# EAGLE board 1700-0002_InterfaceBoard_RevA (EAGLE 7.7.0), part 1 of 2
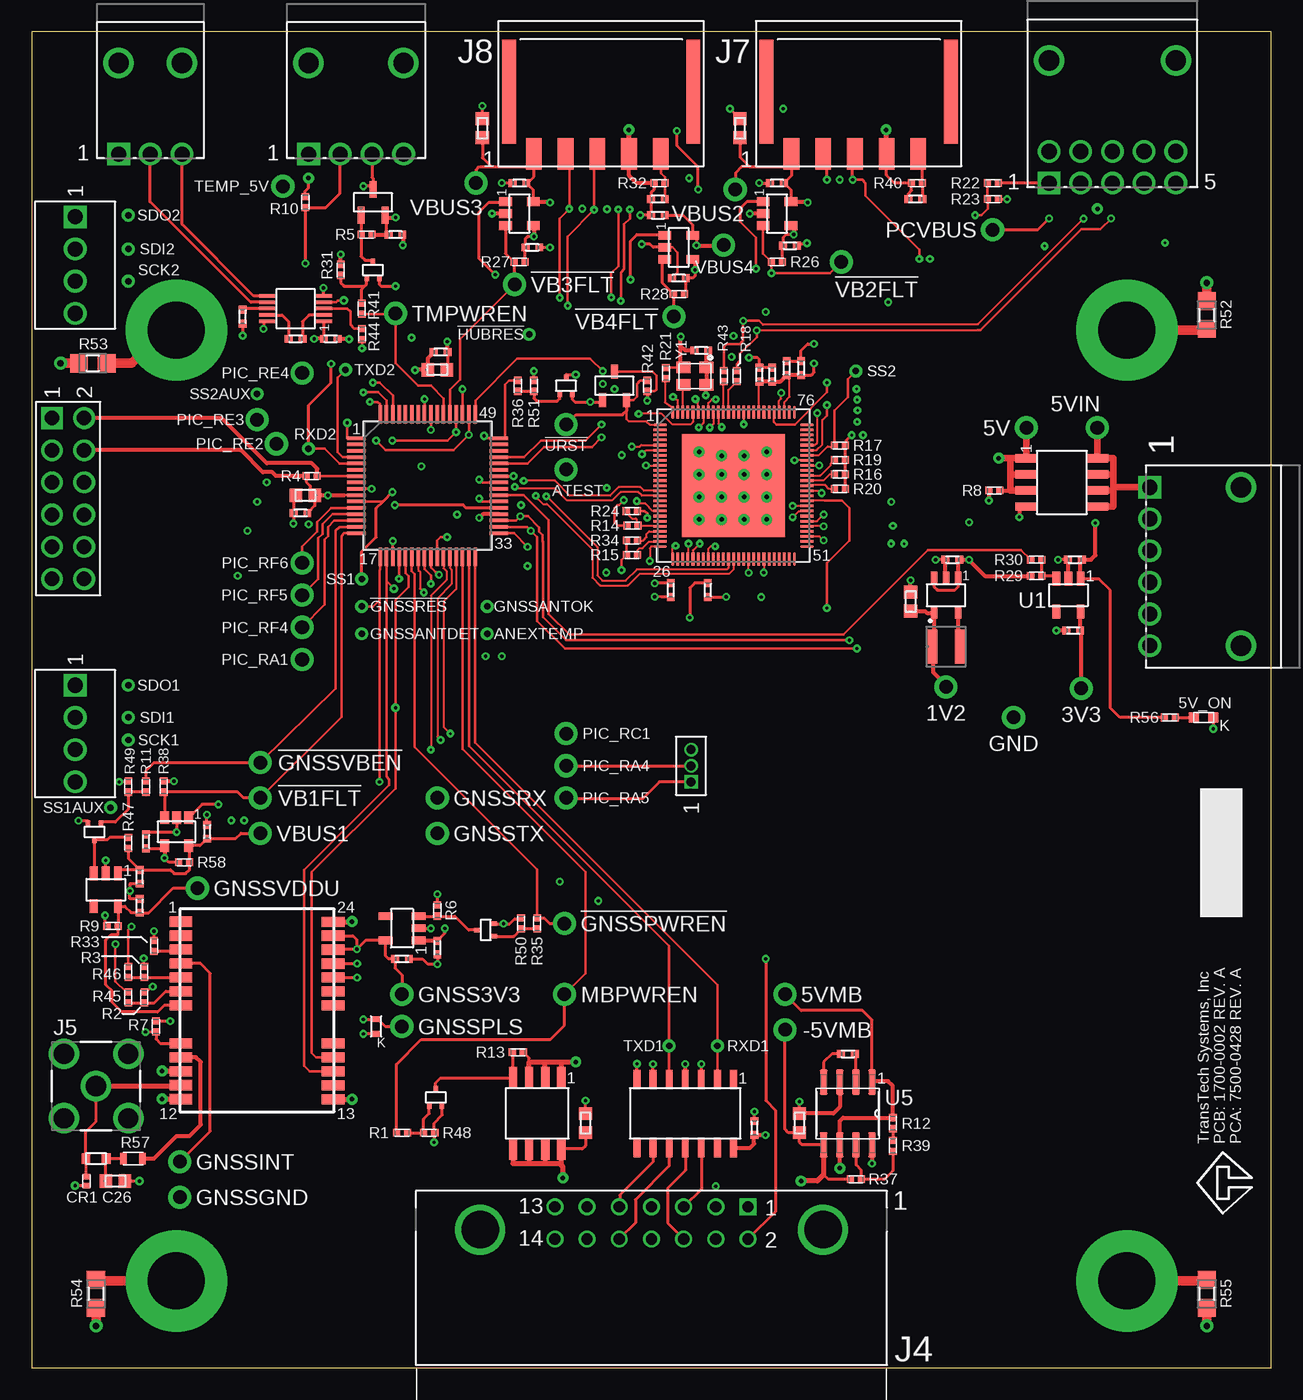
[diagram p8: board, top side]
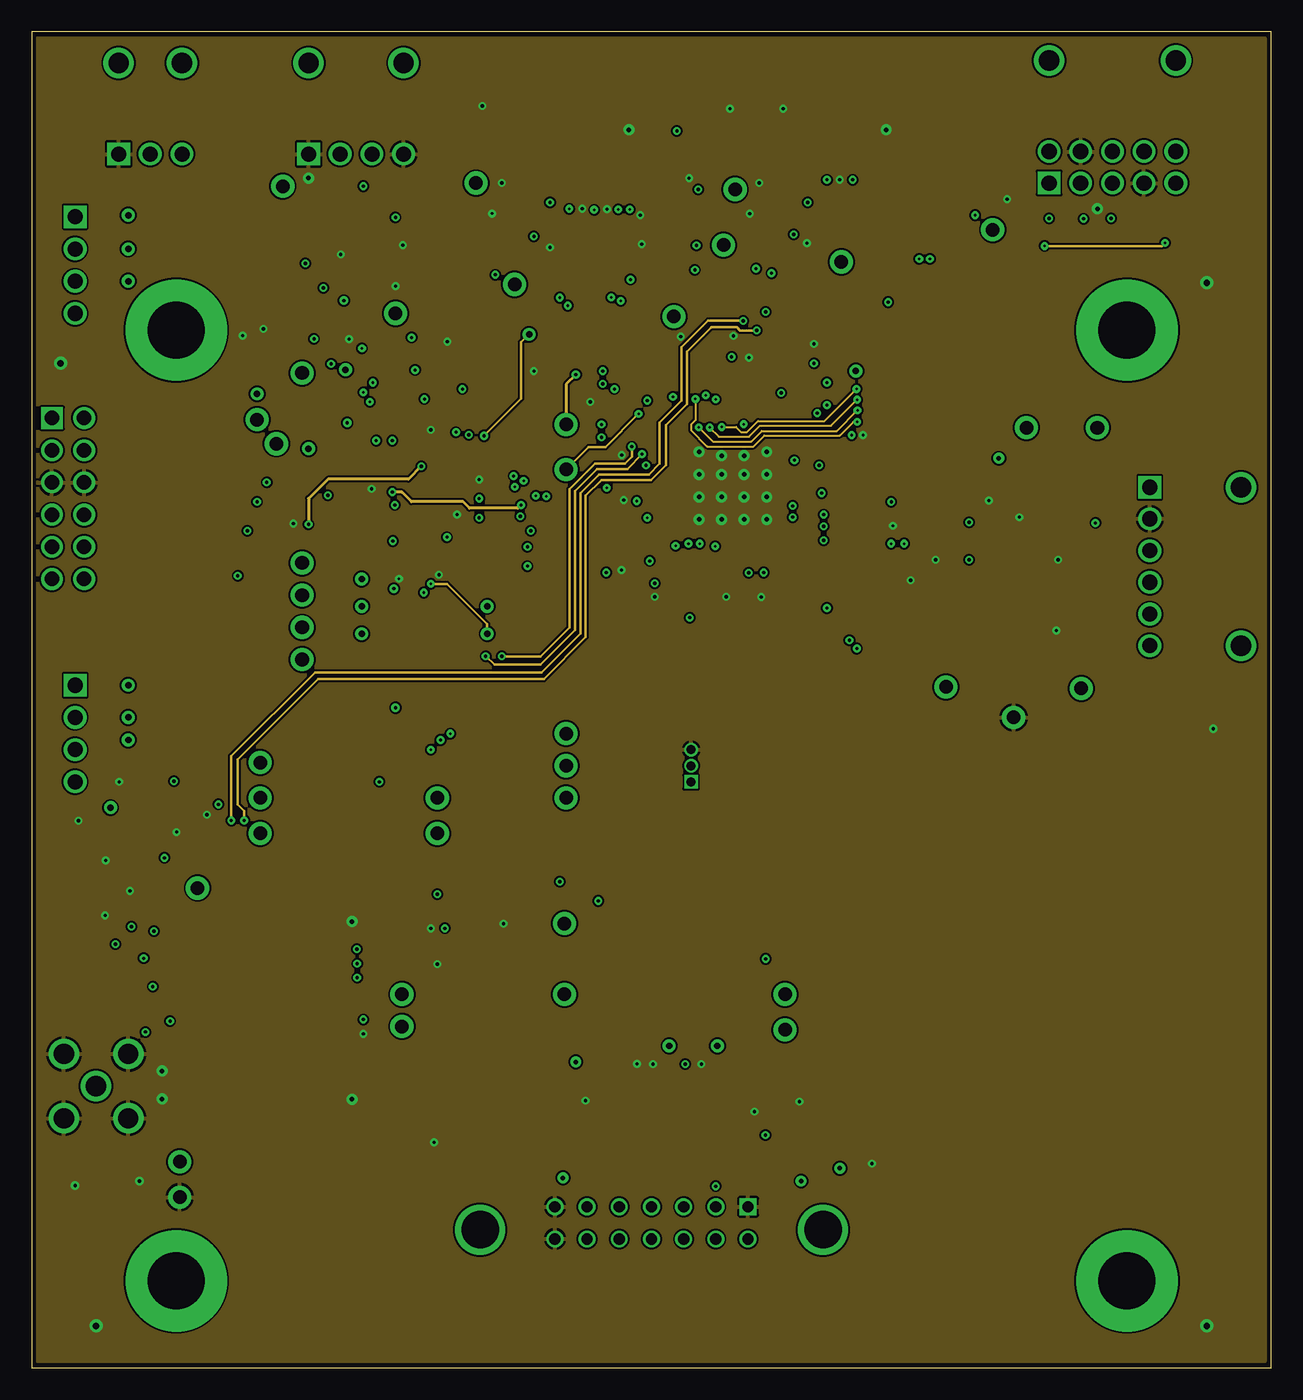
[diagram p9: board, inner layer GND+Signal]
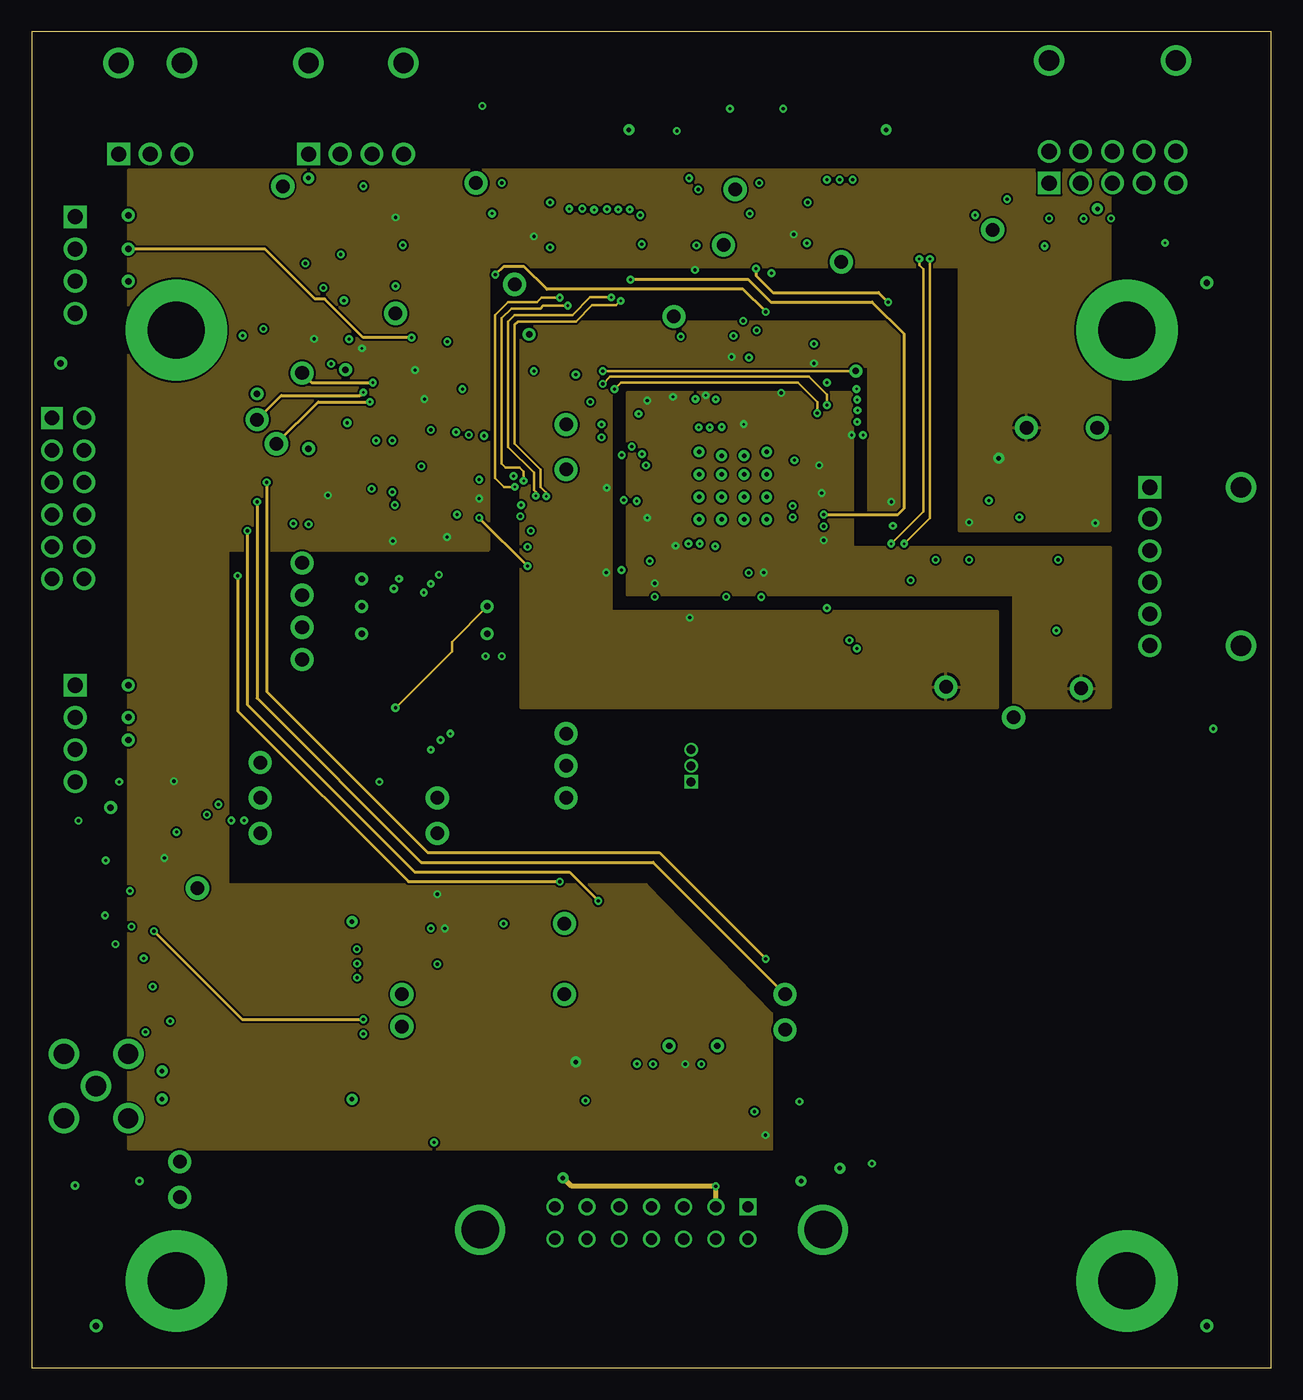
[diagram p10: board, inner layer PWR+Signal]
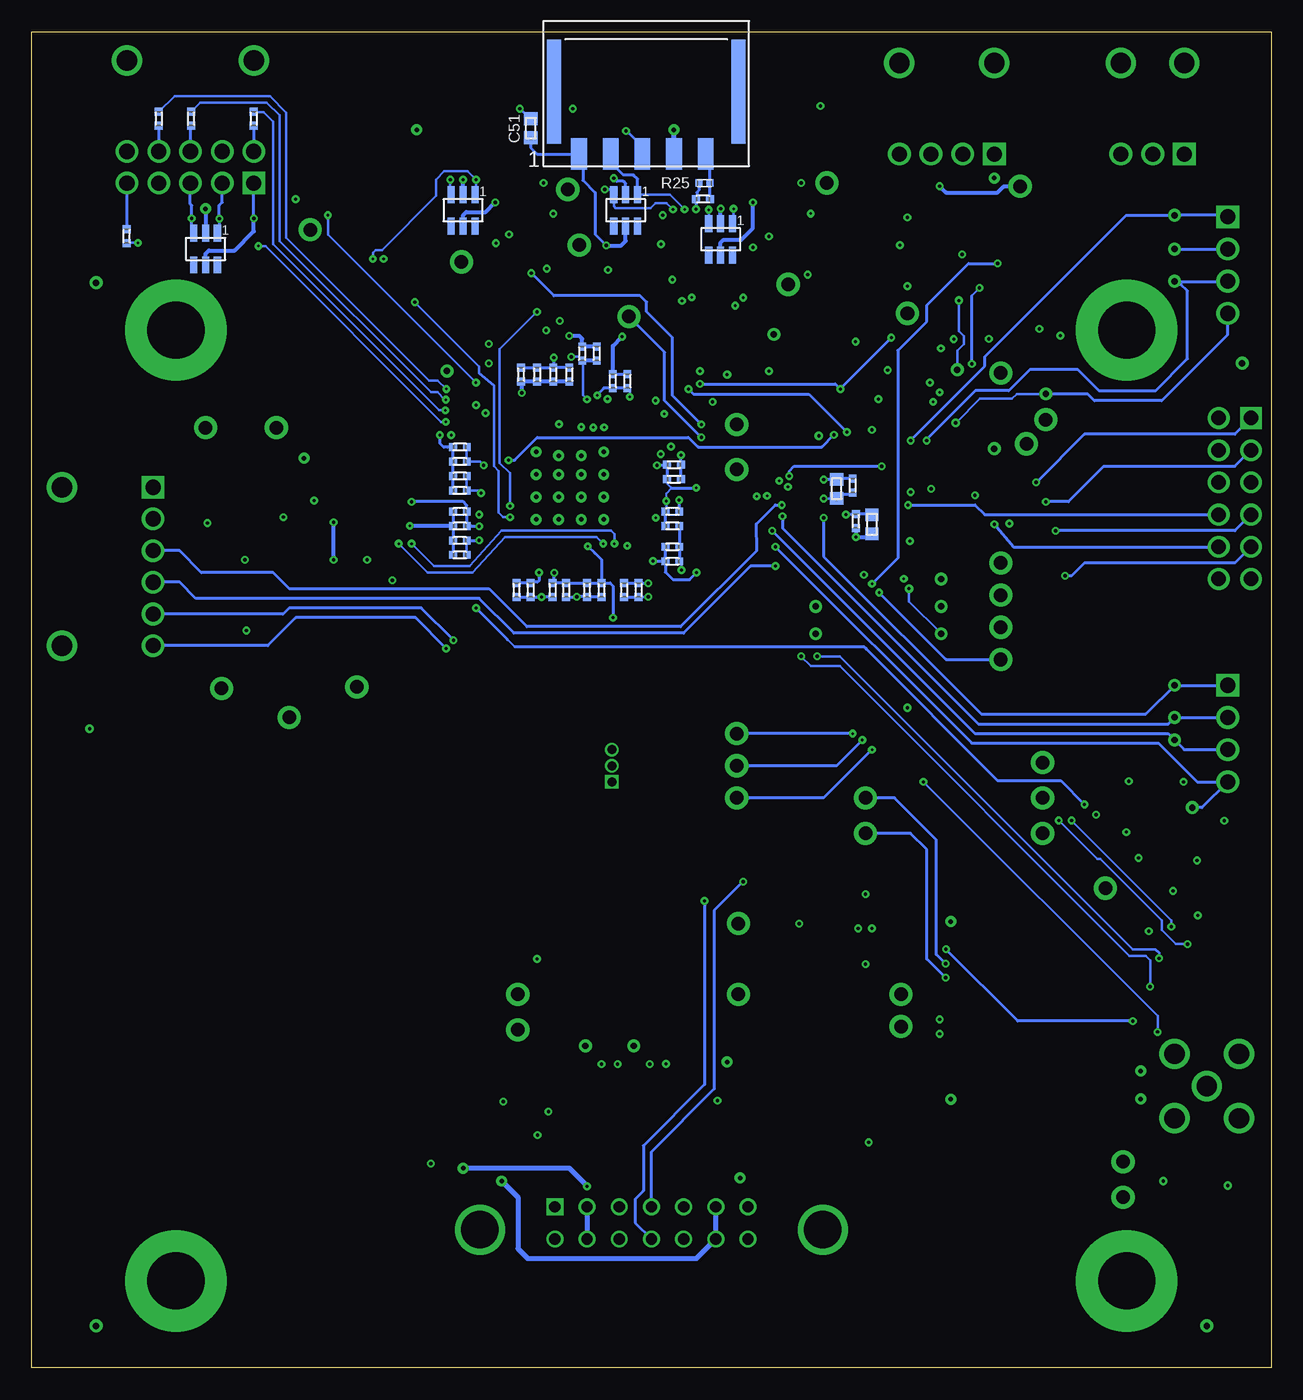
[diagram p11: board, bottom side, seen from below]

Size 97.79 x 105.41 mm. Coordinates in mm from the lower left corner, seen from the top.
Outline: 0,0 97.79,0 97.79,105.41 0,105.41 0,0
Copper layers (1+2*15+16): Top 0.035mm / dielectric 0.11mm / GND+Signal 0.035mm / dielectric 1.2mm / PWR+Signal 0.035mm / dielectric 0.11mm / Bottom 0.035mm
Design rules "PCBWay_4L_100um-Track": minimum track width 0.1mm, minimum drill 0.3mm, track to track 0.1mm, track to pad 0.1mm, pad to pad 0.1mm, via to via 0.1mm, smd to smd 0mil, copper to edge 0.3mm, drill to drill 10mil, minimum pad ring 6mil, minimum via ring 0.1mm, stop-mask expansion 2mil, vias tented up to drill 0.45mm, thermal gap 0.2mm
Net classes: 0 default: width 0.152 mm, drill 0.203 mm, clearance 0.152 mm

## Footprints (pad centres in the part's own frame; a part is rotated, then mirrored left to right if it is on the bottom)
TST_POINT_PTH_042-OCT = drill 1.067 pad 1.829: P$1 0,0
LED_0603_LITE-ON = smd 0.787 x 0.787: 1 -0.762,0; 2 0.762,0
TST_POINT_PTH_20X40MIL_2PIN = drill 0.508 pad 1.016: P$1 0,0; P$2 0,0
G-155_MUR = smd 0.62 x 0.62: 1 -0.546,0; 2 0.546,0
CAP_C1608_TDK = smd 1 x 1.05: 1 -0.75,0; 2 0.75,0
SOD-923F_COMCHIP = smd 0.406 x 0.61: 1 -0.356,0; 2 0.356,0
LED_DIALIGHT_598_DIA = smd 0.445 x 0.711: 1 -0.578,0; 2 0.578,0
CON_1053131306 = drill 1.194 pad 1.702 square: 1 0,0 | drill 1.194 pad 1.702: 2 -2.489,0; 3 -5.004,0; 4 -7.493,0; 5 -10.008,0; 6 -12.497,0 | drill 1.6 pad 1.6: 7 0,-7.188; 8 -12.497,-7.188
CON_1053141310 = drill 1.194 pad 1.702 square: 1 0,0 | drill 1.194 pad 1.702: 2 -2.489,0; 3 -5.004,0; 4 -7.493,0; 5 -10.008,0; 6 0,-2.489; 7 -2.489,-2.489; 8 -5.004,-2.489; 9 -7.493,-2.489; 10 -10.008,-2.489 | drill 1.6 pad 1.6: 11 0,-9.677; 12 -10.008,-9.677
CON_1053131303 = drill 1.194 pad 1.702 square: 1 0,0 | drill 1.194 pad 1.702: 2 -2.489,0; 3 -5.004,0 | drill 1.6 pad 1.6: 4 0,-7.188; 5 -5.004,-7.188
3M_N3314-5302RB_RA = drill 0.889 square: 1 -7.62,-1.27 | drill 0.889: 2 -7.62,1.27; 3 -5.08,-1.27; 4 -5.08,1.27; 5 -2.54,-1.27; 6 -2.54,1.27; 7 0,-1.27; 8 0,1.27; 9 2.54,-1.27; 10 2.54,1.27; 11 5.08,-1.27; 12 5.08,1.27; 13 7.62,-1.27; 14 7.62,1.27 | drill 2.946: 15 -13.538,0.533; 16 13.513,0.533
SAMTEC_SMA-J-P-X-ST-TH1 = drill 1.6: 1 0,0; 2 2.54,-2.54; 3 2.54,2.54; 4 -2.54,2.54; 5 -2.54,-2.54
CON_1053131304 = drill 1.194 pad 1.702 square: 1 0,0 | drill 1.194 pad 1.702: 2 -2.489,0; 3 -5.004,0; 4 -7.493,0 | drill 1.6 pad 1.6: 5 0,-7.188; 6 -7.493,-7.188
CON_1054301305_MOL = smd 1.24 x 2.5: 1 0,0; 2 -2.5,0; 3 -5,0; 4 -7.5,0; 5 -10,0 | smd 1.1 x 8.2: 6 1.97,-4.93; 7 -12.57,-4.93
MOLEX_VERT-HDR_171861004 = drill 1.194 pad 1.702 square: 1 -3.81,0 | drill 1.194 pad 1.702: 2 -1.27,0; 3 1.27,0; 4 3.81,0
CONN_GRPB031VWVN-RC_SUL = drill 0.711 pad 0.965 square: 1 0,0 | drill 0.711 pad 0.965: 2 1.27,0; 3 2.54,0
IND_TAIYO_NR3012_TAY = smd 0.8 x 2.692: 1 -1.099,0; 2 1.099,0
INDUCTOR_0603_TDK = smd 0.7 x 0.8: 1 -0.8,0; 2 0.8,0
CON_901311086_MOL = drill 1.143 pad 1.499 square: 1 0,0 | drill 1.143 pad 1.499: 2 0,2.54; 3 2.54,0; 4 2.54,2.54; 5 5.08,0; 6 5.08,2.54; 7 7.62,0; 8 7.62,2.54; 9 10.16,0; 10 10.16,2.54; 11 12.7,0; 12 12.7,2.54
PTH_M4_4.5MM-ID = drill 4.5 pad 8: P$1 0,0
SO-8L-NB_FAS = smd 1.753 x 0.66: 1 -2.8,1.905; 2 -2.8,0.635; 3 -2.8,-0.635; 4 -2.8,-1.905; 5 2.8,-1.905; 6 2.8,-0.635; 7 2.8,0.635; 8 2.8,1.905
SC-75(SOT-416)_ONSEMI = smd 0.356 x 0.508: 1 -0.495,-0.648; 2 0.495,-0.648; 3 0,0.648
SOT_1CDS-T1-BE3_VIS = smd 0.559 x 1.321: 1 -0.95,-1.016; 2 0.95,-1.016; 3 0,1.016
RESC1005X35N = smd 0.56 x 0.6: 1 -0.435,0; 2 0.435,0
STA_HCJ0805_STP = smd 1.4 x 1.44: 1 -1.1,0; 2 1.1,0
STA_RMCF0603_STP = smd 0.5 x 0.9: 1 -0.75,0; 2 0.75,0
DBV0005A_L = smd 1.1 x 0.6: 1 -1.3,0.95; 2 -1.3,0; 3 -1.3,-0.95; 4 1.3,-0.95; 5 1.3,0.95
DBV5_TEX = smd 0.978 x 0.508: 1 -1.365,0.95; 2 -1.365,0; 3 -1.365,-0.95; 4 1.365,-0.95; 5 1.365,0.95
SOT-23-6_AOS = smd 1.321 x 0.559: 1 -1.245,0.94; 2 -1.245,0; 3 -1.245,-0.94; 4 1.245,-0.94; 5 1.245,0; 6 1.245,0.94
21-0061L_MXM = smd 1.359 x 0.279: 1 -2.203,1; 2 -2.203,0.5; 3 -2.203,0; 4 -2.203,-0.5; 5 -2.203,-1; 6 2.203,-1; 7 2.203,-0.5; 8 2.203,0; 9 2.203,0.5; 10 2.203,1
SOIC127P600X175-8N = smd 1.97 x 0.59: 1 -2.475,1.905; 2 -2.475,0.635; 3 -2.475,-0.635; 4 -2.475,-1.905; 5 2.475,-1.905; 6 2.475,-0.635; 7 2.475,0.635; 8 2.475,1.905
21-0041B_14_MXM = smd 1.46 x 0.533: 1 -2.724,3.81; 2 -2.724,2.54; 3 -2.724,1.27; 4 -2.724,0; 5 -2.724,-1.27; 6 -2.724,-2.54; 7 -2.724,-3.81; 8 2.724,-3.81; 9 2.724,-2.54; 10 2.724,-1.27; 11 2.724,0; 12 2.724,1.27; 13 2.724,2.54; 14 2.724,3.81
TSOT-25_DIODES-INC = smd 1 x 0.7: 1 -1.1,0.95; 2 -1.1,0; 3 -1.1,-0.95; 4 1.1,-0.95; 5 1.1,0.95
UBLOX_24LCC = smd 1.8 x 0.8: 1 6.001,-7.004; 2 6.001,-5.904; 3 6.001,-4.804; 4 6.001,-3.704; 5 6.001,-2.604; 6 6.001,-1.504; 7 6.001,-0.404; 8 6.001,2.596; 9 6.001,3.696; 10 6.001,4.796; 11 6.001,5.896; 12 6.001,6.996; 13 -6.001,7.004; 14 -6.001,5.904; 15 -6.001,4.804; 16 -6.001,3.704; 17 -6.001,2.604; 18 -6.001,-0.396; 19 -6.001,-1.496; 20 -6.001,-2.596; 21 -6.001,-3.696; 22 -6.001,-4.796; 23 -6.001,-5.896; 24 -6.001,-6.996
TQFP64_10X10MC_MCH = smd 1.462 x 0.279: 1 -5.613,3.75; 2 -5.613,3.25; 3 -5.613,2.75; 4 -5.613,2.25; 5 -5.613,1.75; 6 -5.613,1.25; 7 -5.613,0.75; 8 -5.613,0.25; 9 -5.613,-0.25; 10 -5.613,-0.75; 11 -5.613,-1.25; 12 -5.613,-1.75; 13 -5.613,-2.25; 14 -5.613,-2.75; 15 -5.613,-3.25; 16 -5.613,-3.75; 33 5.613,-3.75; 34 5.613,-3.25; 35 5.613,-2.75; 36 5.613,-2.25; 37 5.613,-1.75; 38 5.613,-1.25; 39 5.613,-0.75; 40 5.613,-0.25; 41 5.613,0.25; 42 5.613,0.75; 43 5.613,1.25; 44 5.613,1.75; 45 5.613,2.25; 46 5.613,2.75; 47 5.613,3.25; 48 5.613,3.75 | smd 0.279 x 1.462: 17 -3.75,-5.613; 18 -3.25,-5.613; 19 -2.75,-5.613; 20 -2.25,-5.613; 21 -1.75,-5.613; 22 -1.25,-5.613; 23 -0.75,-5.613; 24 -0.25,-5.613; 25 0.25,-5.613; 26 0.75,-5.613; 27 1.25,-5.613; 28 1.75,-5.613; 29 2.25,-5.613; 30 2.75,-5.613; 31 3.25,-5.613; 32 3.75,-5.613; 49 3.75,5.613; 50 3.25,5.613; 51 2.75,5.613; 52 2.25,5.613; 53 1.75,5.613; 54 1.25,5.613; 55 0.75,5.613; 56 0.25,5.613; 57 -0.25,5.613; 58 -0.75,5.613; 59 -1.25,5.613; 60 -1.75,5.613; 61 -2.25,5.613; 62 -2.75,5.613; 63 -3.25,5.613; 64 -3.75,5.613
SOT-23_M3_MCH = smd 0.559 x 1.118: 1 -0.95,-1.118; 2 0.95,-1.118; 3 0,1.118
VQFN100_KDX_MCH = smd 1.016 x 0.203: 1 -5.791,4.8; 2 -5.791,4.4; 3 -5.791,4; 4 -5.791,3.6; 5 -5.791,3.2; 6 -5.791,2.8; 7 -5.791,2.4; 8 -5.791,2; 9 -5.791,1.6; 10 -5.791,1.2; 11 -5.791,0.8; 12 -5.791,0.4; 13 -5.791,0; 14 -5.791,-0.4; 15 -5.791,-0.8; 16 -5.791,-1.2; 17 -5.791,-1.6; 18 -5.791,-2; 19 -5.791,-2.4; 20 -5.791,-2.8; 21 -5.791,-3.2; 22 -5.791,-3.6; 23 -5.791,-4; 24 -5.791,-4.4; 25 -5.791,-4.8; 51 5.791,-4.8; 52 5.791,-4.4; 53 5.791,-4; 54 5.791,-3.6; 55 5.791,-3.2; 56 5.791,-2.8; 57 5.791,-2.4; 58 5.791,-2; 59 5.791,-1.6; 60 5.791,-1.2; 61 5.791,-0.8; 62 5.791,-0.4; 63 5.791,0; 64 5.791,0.4; 65 5.791,0.8; 66 5.791,1.2; 67 5.791,1.6; 68 5.791,2; 69 5.791,2.4; 70 5.791,2.8; 71 5.791,3.2; 72 5.791,3.6; 73 5.791,4; 74 5.791,4.4; 75 5.791,4.8 | smd 0.203 x 1.016: 26 -4.8,-5.791; 27 -4.4,-5.791; 28 -4,-5.791; 29 -3.6,-5.791; 30 -3.2,-5.791; 31 -2.8,-5.791; 32 -2.4,-5.791; 33 -2,-5.791; 34 -1.6,-5.791; 35 -1.2,-5.791; 36 -0.8,-5.791; 37 -0.4,-5.791; 38 0,-5.791; 39 0.4,-5.791; 40 0.8,-5.791; 41 1.2,-5.791; 42 1.6,-5.791; 43 2,-5.791; 44 2.4,-5.791; 45 2.8,-5.791; 46 3.2,-5.791; 47 3.6,-5.791; 48 4,-5.791; 49 4.4,-5.791; 50 4.8,-5.791; 76 4.8,5.791; 77 4.4,5.791; 78 4,5.791; 79 3.6,5.791; 80 3.2,5.791; 81 2.8,5.791; 82 2.4,5.791; 83 2,5.791; 84 1.6,5.791; 85 1.2,5.791; 86 0.8,5.791; 87 0.4,5.791; 88 0,5.791; 89 -0.4,5.791; 90 -0.8,5.791; 91 -1.2,5.791; 92 -1.6,5.791; 93 -2,5.791; 94 -2.4,5.791; 95 -2.8,5.791; 96 -3.2,5.791; 97 -3.6,5.791; 98 -4,5.791; 99 -4.4,5.791; 100 -4.8,5.791 | smd 8.103 x 8.103: 101 0,0
OSC_ECS-2033-250-BN = smd 1.1 x 0.9: 1 -0.9,-0.7; 2 0.9,-0.7; 3 0.9,0.7; 4 -0.9,0.7

## Placement (x,y rotation side)
1V2  TST_POINT_PTH_042-OCT  [TST_POINT_PTH_042-OCT]  72.14,53.72 0 top
3V3  TST_POINT_PTH_042-OCT  [TST_POINT_PTH_042-OCT]  82.8,53.59 0 top
5V  TST_POINT_PTH_042-OCT  [TST_POINT_PTH_042-OCT]  78.49,74.17 0 top
5V_ON  0603/RED/1.8V/2.5mA  [LED_0603_LITE-ON]  92.46,51.31 180 top
5VIN  TST_POINT_PTH_042-OCT  [TST_POINT_PTH_042-OCT]  84.07,74.17 0 top
5VMB  TST_POINT_PTH_042-OCT  [TST_POINT_PTH_042-OCT]  59.44,29.46 0 top
!GNSSPWREN  TST_POINT_PTH_042-OCT  [TST_POINT_PTH_042-OCT]  42.04,35.05 0 top
!GNSSRES  TST_POINT_PTH_20X40MIL_2PIN  [TST_POINT_PTH_20X40MIL_2PIN]  26.04,60.07 0 top
!GNSSVBEN  TST_POINT_PTH_042-OCT  [TST_POINT_PTH_042-OCT]  18.03,47.75 0 top
!HUBRES  TST_POINT_PTH_20X40MIL_2PIN  [TST_POINT_PTH_20X40MIL_2PIN]  39.24,81.53 0 top
!URST  TST_POINT_PTH_042-OCT  [TST_POINT_PTH_042-OCT]  42.16,74.42 0 top
!VB1FLT  TST_POINT_PTH_042-OCT  [TST_POINT_PTH_042-OCT]  18.03,44.96 0 top
!VB2FLT  TST_POINT_PTH_042-OCT  [TST_POINT_PTH_042-OCT]  63.88,87.25 0 top
!VB3FLT  TST_POINT_PTH_042-OCT  [TST_POINT_PTH_042-OCT]  38.1,85.47 0 top
!VB4FLT  TST_POINT_PTH_042-OCT  [TST_POINT_PTH_042-OCT]  50.67,82.93 0 top
-5VMB  TST_POINT_PTH_042-OCT  [TST_POINT_PTH_042-OCT]  59.44,26.67 0 top
ANEXTEMP  TST_POINT_PTH_20X40MIL_2PIN  [TST_POINT_PTH_20X40MIL_2PIN]  35.94,57.91 0 top
ATEST  TST_POINT_PTH_042-OCT  [TST_POINT_PTH_042-OCT]  42.16,70.87 0 top
C1  0.1/16V (0402)  [G-155_MUR]  33.02,69.6 90 bottom
C2  0.1/16V (0402)  [G-155_MUR]  21.21,67.44 180 top
C3  0.1/16V (0402)  [G-155_MUR]  20.83,81.18 0 top
C4  1nF (0402)  [G-155_MUR]  49.91,61.37 270 bottom
C5  1nF (0402)  [G-155_MUR]  50.8,77.85 90 bottom
C6  1nF (0402)  [G-155_MUR]  64.01,65.28 180 bottom
C7  0.1 (0402)  [G-155_MUR]  51.05,61.37 270 bottom
C8  0.1 (0402)  [G-155_MUR]  51.94,77.85 90 bottom
C9  0.1 (0402)  [G-155_MUR]  64.01,64.14 180 bottom
C10  10/10V (0603)  [CAP_C1608_TDK]  21.59,68.83 180 top
C11  0.1/16V (0402)  [G-155_MUR]  32.26,80.14 0 top
C12  0.1/16V (0402)  [G-155_MUR]  23.6,81.18 0 top
C13  0.1/16V (0402)  [G-155_MUR]  16.64,82.93 270 top
C14  1nF (0402)  [G-155_MUR]  64.01,69.22 180 bottom
C15  1nF (0402)  [G-155_MUR]  64.01,71.5 180 bottom
C16  1nF (0402)  [G-155_MUR]  59.18,78.36 90 bottom
C17  0.1 (0402)  [G-155_MUR]  64.01,70.36 180 bottom
C18  0.1 (0402)  [G-155_MUR]  64.01,72.64 180 bottom
C19  1/10V (0402)  [G-155_MUR]  8.51,38.73 270 top
C20  1/10V (0402)  [G-155_MUR]  8.51,36.45 90 top
C21  1nF (0402)  [G-155_MUR]  58.42,61.37 270 bottom
C22  1nF (0402)  [G-155_MUR]  56.64,78.36 90 bottom
C23  0.1 (0402)  [G-155_MUR]  57.91,78.36 90 bottom
C24  0.1 (0402)  [G-155_MUR]  55.37,78.36 90 bottom
C25  0.1 (0402)  [G-155_MUR]  58.42,78.36 90 top
C26  10nF/16V (0603)  [CAP_C1608_TDK]  6.6,14.73 0 top
C27  10/10V (0603)  [CAP_C1608_TDK]  32,78.74 0 top
C28  1nF (0402)  [G-155_MUR]  56.69,61.37 270 bottom
C29  0.1 (0402)  [G-155_MUR]  60.71,78.87 90 top
C30  1nF (0402)  [G-155_MUR]  47.12,71.25 0 bottom
C31  0.1 (0402)  [G-155_MUR]  64.01,67.56 180 bottom
C32  22/10V (0603)  [CAP_C1608_TDK]  60.58,19.3 90 top
C33  1/10V (0402)  [G-155_MUR]  59.82,88.52 0 top
C34  0.1/16V (0402)  [G-155_MUR]  57.02,18.92 90 top
C35  1nF (0402)  [G-155_MUR]  47.24,67.56 0 bottom
C36  1nF (0402)  [G-155_MUR]  47.24,64.77 0 bottom
C37  0.1 (0402)  [G-155_MUR]  54.36,80.01 90 bottom
C38  0.1 (0402)  [G-155_MUR]  53.98,61.37 270 bottom
C39  1nF (0402)  [G-155_MUR]  52.83,61.37 270 bottom
C40  1nF (0402)  [G-155_MUR]  53.21,80.01 90 bottom
C41  0.1 (0402)  [G-155_MUR]  47.24,63.63 0 bottom
C42  0.1 (0402)  [G-155_MUR]  47.24,66.42 0 bottom
C43  0.1/16V (0402)  [G-155_MUR]  13.84,42.29 90 top
C44  4.7/10V (0402)  [G-155_MUR]  50.42,61.37 270 top
C45  1nF (0402)  [G-155_MUR]  64.01,66.42 180 bottom
C46  0.1 (0402)  [G-155_MUR]  47.12,70.1 0 bottom
C47  1nF (0402)  [G-155_MUR]  59.56,78.87 90 top
C48  0.1 (0402)  [G-155_MUR]  55.63,61.37 270 bottom
C49  0.1/16V (0402)  [G-155_MUR]  52.83,80.26 180 top
C50  1/10V (0402)  [G-155_MUR]  32,33.15 270 top
C51  47/6.3V (0603)  [CAP_C1608_TDK]  58.42,97.79 90 bottom
C52  47/6.3V (0603)  [CAP_C1608_TDK]  35.56,97.79 90 top
C53  4.7/10V (0402)  [G-155_MUR]  53.34,61.37 270 top
C54  0.1/16V (0402)  [G-155_MUR]  58.8,93.47 180 top
C55  1nF (0402)  [G-155_MUR]  57.4,78.36 90 top
C56  22/10V (0603)  [CAP_C1608_TDK]  43.69,19.3 90 top
C58  1/10V (0402)  [G-155_MUR]  39.5,88.39 0 top
C59  1/10V (0402)  [G-155_MUR]  29.21,32.26 0 top
C60  0.1 (0402)  [G-155_MUR]  44.83,92.2 0 bottom
C61  0.1/16V (0402)  [G-155_MUR]  38.48,93.47 180 top
C62  1/10V (0402)  [G-155_MUR]  51.05,85.98 180 top
C63  0.1 (0402)  [G-155_MUR]  90.3,89.28 270 bottom
C64  0.1 (0402)  [G-155_MUR]  80.26,98.55 90 bottom
C65  0.1 (0402)  [G-155_MUR]  49.4,92.2 0 top
C66  0.1/16V (0402)  [G-155_MUR]  49.4,90.93 180 top
C67  0.1 (0402)  [G-155_MUR]  69.72,92.2 0 top
C68  0.1 (0402)  [G-155_MUR]  85.22,98.55 90 bottom
C69  0.1 (0402)  [G-155_MUR]  87.76,98.55 90 bottom
C70  47/6.3V (0603)  [CAP_C1608_TDK]  55.88,97.79 90 top
C71  1/10V (0402)  [G-155_MUR]  9.02,41.53 90 top
C72  1/10V (0402)  [G-155_MUR]  82.3,63.75 180 top
C73  1/10V (0402)  [G-155_MUR]  82.17,58.17 180 top
C74  4.7/10V (0402)  [G-155_MUR]  72.64,63.75 180 top
C75  4.7/10V (0402)  [G-155_MUR]  28.7,89.41 0 top
C76  4.7/10V (0402)  [G-155_MUR]  64.39,24.77 180 top
C77  10/10V (0603)  [CAP_C1608_TDK]  34.29,69.34 90 bottom
C78  0.1/16V (0402)  [G-155_MUR]  32.77,66.8 90 bottom
C79  10/10V (0603)  [CAP_C1608_TDK]  31.5,66.55 90 bottom
C80  10/6.3V (0603)  [CAP_C1608_TDK]  69.34,60.45 90 top
C81  0.1 (0402)  [G-155_MUR]  59.54,61.37 270 bottom
CR1  3.3VW, 5VC (SOD-923F)  [SOD-923F_COMCHIP]  4.32,14.73 270 top
GND  TST_POINT_PTH_042-OCT  [TST_POINT_PTH_042-OCT]  77.47,51.31 0 top
GNSS3V3  TST_POINT_PTH_042-OCT  [TST_POINT_PTH_042-OCT]  29.21,29.46 0 top
GNSSANTDET  TST_POINT_PTH_20X40MIL_2PIN  [TST_POINT_PTH_20X40MIL_2PIN]  26.04,57.91 0 top
GNSSANTOK  TST_POINT_PTH_20X40MIL_2PIN  [TST_POINT_PTH_20X40MIL_2PIN]  35.94,60.07 0 top
GNSSGND  TST_POINT_PTH_042-OCT  [TST_POINT_PTH_042-OCT]  11.68,13.46 0 top
GNSSINT  TST_POINT_PTH_042-OCT  [TST_POINT_PTH_042-OCT]  11.68,16.26 0 top
GNSSPLS  TST_POINT_PTH_042-OCT  [TST_POINT_PTH_042-OCT]  29.21,26.92 0 top
GNSSPULSE  GRN (0603)  [LED_DIALIGHT_598_DIA]  27.18,26.92 90 top
GNSSRX  TST_POINT_PTH_042-OCT  [TST_POINT_PTH_042-OCT]  32,44.96 0 top
GNSSTX  TST_POINT_PTH_042-OCT  [TST_POINT_PTH_042-OCT]  32,42.16 0 top
GNSSVDDU  TST_POINT_PTH_042-OCT  [TST_POINT_PTH_042-OCT]  13.08,37.85 0 top
J1  [CON_1053131306]  88.21,69.47 90 top
J2  CON_MOLEX_1053141310  [CON_1053141310]  80.26,93.47 180 top
J3  CON_MOLEX_1053131303  [CON_1053131303]  6.86,95.76 180 top
J4  CON_3M_RA_N3314-5302RB  [3M_N3314-5302RB_RA]  48.9,11.43 180 top
J5  [SAMTEC_SMA-J-P-X-ST-TH1]  5.08,22.23 0 top
J6  CON_MOLEX_1053131304  [CON_1053131304]  21.84,95.76 180 top
J7  CON_MOLEX_1054301305  [CON_1054301305_MOL]  59.94,95.76 180 top
J8  CON_MOLEX_1054301305  [CON_1054301305_MOL]  39.62,95.76 180 top
J9  CON_MOLEX_1054301305  [CON_1054301305_MOL]  54.61,95.76 180 bottom
J10  MOLEX_VERT-HDR_1718561004  [MOLEX_VERT-HDR_171861004]  3.43,50.04 270 top
J11  MOLEX_VERT-HDR_1718561004  [MOLEX_VERT-HDR_171861004]  3.43,87 270 top
J12  [CONN_GRPB031VWVN-RC_SUL]  52.02,46.23 90 top
L1  2.2uH, 1.2A  [IND_TAIYO_NR3012_TAY]  72.14,56.9 0 top
L2  27nH (0603)  [INDUCTOR_0603_TDK]  5.08,16.51 0 top
MBPWREN  TST_POINT_PTH_042-OCT  [TST_POINT_PTH_042-OCT]  42.04,29.46 0 top
PCVBUS  TST_POINT_PTH_042-OCT  [TST_POINT_PTH_042-OCT]  75.82,89.79 0 top
PIC_RA1  TST_POINT_PTH_042-OCT  [TST_POINT_PTH_042-OCT]  21.34,55.88 0 top
PIC_RA4  TST_POINT_PTH_042-OCT  [TST_POINT_PTH_042-OCT]  42.16,47.5 0 top
PIC_RA5  TST_POINT_PTH_042-OCT  [TST_POINT_PTH_042-OCT]  42.16,44.96 0 top
PIC_RC1  TST_POINT_PTH_042-OCT  [TST_POINT_PTH_042-OCT]  42.16,50.04 0 top
PIC_RE2  TST_POINT_PTH_042-OCT  [TST_POINT_PTH_042-OCT]  19.3,72.9 0 top
PIC_RE3  TST_POINT_PTH_042-OCT  [TST_POINT_PTH_042-OCT]  17.78,74.8 0 top
PIC_RE4  TST_POINT_PTH_042-OCT  [TST_POINT_PTH_042-OCT]  21.34,78.49 0 top
PIC_RF4  TST_POINT_PTH_042-OCT  [TST_POINT_PTH_042-OCT]  21.34,58.42 0 top
PIC_RF5  TST_POINT_PTH_042-OCT  [TST_POINT_PTH_042-OCT]  21.34,60.96 0 top
PIC_RF6  TST_POINT_PTH_042-OCT  [TST_POINT_PTH_042-OCT]  21.34,63.5 0 top
PK3  CON_MOLEX_901311086  [CON_901311086_MOL]  1.6,74.93 270 top
PTH1  PTH_M4_4.5MM-ID_MIDDLE-FIT  [PTH_M4_4.5MM-ID]  86.41,81.86 0 top
PTH2  PTH_M4_4.5MM-ID_MIDDLE-FIT  [PTH_M4_4.5MM-ID]  11.4,81.86 0 top
PTH3  PTH_M4_4.5MM-ID_MIDDLE-FIT  [PTH_M4_4.5MM-ID]  11.4,6.86 0 top
PTH4  PTH_M4_4.5MM-ID_MIDDLE-FIT  [PTH_M4_4.5MM-ID]  86.41,6.86 0 top
Q1  P-ch, -20V, -11.5A, 12.5mOhm (8-SOIC)  [SO-8L-NB_FAS]  81.28,69.85 0 top
Q2  MMBT2222ATT3G  [SC-75(SOT-416)_ONSEMI]  26.92,86.61 0 top
Q3  P-CH/-20V/-3A/0.09OHM  [SOT_1CDS-T1-BE3_VIS]  26.92,91.95 0 top
Q4  MMBT2222ATT3G  [SC-75(SOT-416)_ONSEMI]  31.88,21.34 0 top
Q5  P-ch, -20V, -11.5A, 12.5mOhm (8-SOIC)  [SO-8L-NB_FAS]  39.88,20.07 270 top
Q6  MMBT2222ATT3G  [SC-75(SOT-416)_ONSEMI]  35.81,34.54 90 top
Q7  MMBT2222ATT3G  [SC-75(SOT-416)_ONSEMI]  4.95,42.29 180 top
Q8  MMBT2222ATT3G  [SC-75(SOT-416)_ONSEMI]  42.16,77.47 0 top
R1  1K (0402)  [RESC1005X35N]  29.21,18.54 0 top
R2  27 (0402)  [RESC1005X35N]  8.89,29.21 90 top
R3  27 (0402)  [RESC1005X35N]  8.89,31.24 90 top
R4  10K (0402)  [RESC1005X35N]  22.1,70.36 0 top
R5  10K (0402)  [RESC1005X35N]  26.42,89.41 0 top
R6  10K (0402)  [RESC1005X35N]  32,36.07 90 top
R7  11K (0402)  [RESC1005X35N]  9.8,26.92 90 top
R8  10K (0402)  [RESC1005X35N]  75.95,69.22 0 top
R9  10K (0402)  [RESC1005X35N]  6.38,34.85 180 top
R10  1M (0402)  [RESC1005X35N]  21.59,91.95 90 top
R11  1K (0402)  [RESC1005X35N]  9.02,45.85 270 top
R12  10K (0402)  [RESC1005X35N]  67.94,19.3 90 top
R13  10K (0402)  [RESC1005X35N]  38.35,24.89 180 top
R14  DNP (0402)  [RESC1005X35N]  47.4,66.45 180 top
R15  10K (0402)  [RESC1005X35N]  47.37,64.14 180 top
R16  10K (0402)  [RESC1005X35N]  63.75,70.48 180 top
R17  10K (0402)  [RESC1005X35N]  63.75,72.77 180 top
R18  0 (0402)  [RESC1005X35N]  55.63,78.23 90 top
R19  10K (0402)  [RESC1005X35N]  63.75,71.63 180 top
R20  10K (0402)  [RESC1005X35N]  63.75,69.34 180 top
R21  12K (0402)  [RESC1005X35N]  50.04,78.49 270 top
R22  43K (0402)  [RESC1005X35N]  75.82,93.47 0 top
R23  49K (0402)  [RESC1005X35N]  75.82,92.2 180 top
R24  10K (0402)  [RESC1005X35N]  47.35,67.59 180 top
R25  330 (0402)  [RESC1005X35N]  44.7,93.47 180 bottom
R26  10K (0402)  [RESC1005X35N]  58.8,87.25 0 top
R27  10K (0402)  [RESC1005X35N]  38.48,87.25 0 top
R28  10K (0402)  [RESC1005X35N]  51.05,84.71 0 top
R29  0 (0402)  [RESC1005X35N]  79.25,62.48 0 top
R30  DNP (0402)  [RESC1005X35N]  79.25,63.75 180 top
R31  10K (0402)  [RESC1005X35N]  24.38,86.61 90 top
R32  330 (0402)  [RESC1005X35N]  49.53,93.47 180 top
R33  100 (0402)  [RESC1005X35N]  9.65,33.27 90 top
R34  200K (0402)  [RESC1005X35N]  47.37,65.28 180 top
R35  1K (0402)  [RESC1005X35N]  39.88,35.05 270 top
R36  1K (0402)  [RESC1005X35N]  38.35,77.47 270 top
R37  100K (0402)  [RESC1005X35N]  65.02,14.88 180 top
R38  10K (0402)  [RESC1005X35N]  10.41,45.85 90 top
R39  100K (0402)  [RESC1005X35N]  67.94,17.53 270 top
R40  330 (0402)  [RESC1005X35N]  69.85,93.47 180 top
R41  1K (0402)  [RESC1005X35N]  26.04,83.57 270 top
R42  100K (0402)  [RESC1005X35N]  48.56,77.47 90 top
R43  0 (0402)  [RESC1005X35N]  54.61,78.23 90 top
R44  10K (0402)  [RESC1005X35N]  26.06,81.56 270 top
R45  27 (0402)  [RESC1005X35N]  7.62,29.21 90 top
R46  27 (0402)  [RESC1005X35N]  7.62,31.24 90 top
R47  10K (0402)  [RESC1005X35N]  7.62,41.4 90 top
R48  10K (0402)  [RESC1005X35N]  31.37,18.54 0 top
R49  10K (0402)  [RESC1005X35N]  7.62,45.85 90 top
R50  10K (0402)  [RESC1005X35N]  38.61,35.05 90 top
R51  10K (0402)  [RESC1005X35N]  39.62,77.47 90 top
R52  0 (0805)  [STA_HCJ0805_STP]  92.71,83.06 270 top
R53  0 (0805)  [STA_HCJ0805_STP]  4.83,79.25 0 top
R54  0 (0805)  [STA_HCJ0805_STP]  5.08,5.84 90 top
R55  0 (0805)  [STA_HCJ0805_STP]  92.71,5.84 90 top
R56  1.3K (0402)  [RESC1005X35N]  89.79,51.31 180 top
R57  10 (0603)  [STA_RMCF0603_STP]  8,16.51 0 top
R58  0 (0402)  [RESC1005X35N]  12.04,39.88 0 top
RXD1  TST_POINT_PTH_20X40MIL_2PIN  [TST_POINT_PTH_20X40MIL_2PIN]  54.1,25.4 0 top
RXD2  TST_POINT_PTH_20X40MIL_2PIN  [TST_POINT_PTH_20X40MIL_2PIN]  21.84,72.52 0 top
SCK1  TST_POINT_PTH_20X40MIL_2PIN  [TST_POINT_PTH_20X40MIL_2PIN]  7.62,49.53 0 top
SCK2  TST_POINT_PTH_20X40MIL_2PIN  [TST_POINT_PTH_20X40MIL_2PIN]  7.62,85.72 0 top
SDI1  TST_POINT_PTH_20X40MIL_2PIN  [TST_POINT_PTH_20X40MIL_2PIN]  7.62,51.31 0 top
SDI2  TST_POINT_PTH_20X40MIL_2PIN  [TST_POINT_PTH_20X40MIL_2PIN]  7.62,88.27 0 top
SDO1  TST_POINT_PTH_20X40MIL_2PIN  [TST_POINT_PTH_20X40MIL_2PIN]  7.62,53.85 0 top
SDO2  TST_POINT_PTH_20X40MIL_2PIN  [TST_POINT_PTH_20X40MIL_2PIN]  7.62,90.93 0 top
SS1  TST_POINT_PTH_20X40MIL_2PIN  [TST_POINT_PTH_20X40MIL_2PIN]  26.04,62.23 0 top
SS1AUX  TST_POINT_PTH_20X40MIL_2PIN  [TST_POINT_PTH_20X40MIL_2PIN]  6.22,44.2 0 top
SS2  TST_POINT_PTH_20X40MIL_2PIN  [TST_POINT_PTH_20X40MIL_2PIN]  65.02,78.64 0 top
SS2AUX  TST_POINT_PTH_20X40MIL_2PIN  [TST_POINT_PTH_20X40MIL_2PIN]  17.78,76.83 0 top
TEMP_5V  TST_POINT_PTH_042-OCT  [TST_POINT_PTH_042-OCT]  19.81,93.22 0 top
TMPWREN  TST_POINT_PTH_042-OCT  [TST_POINT_PTH_042-OCT]  28.7,83.19 0 top
TXD1  TST_POINT_PTH_20X40MIL_2PIN  [TST_POINT_PTH_20X40MIL_2PIN]  50.29,25.4 0 top
TXD2  TST_POINT_PTH_20X40MIL_2PIN  [TST_POINT_PTH_20X40MIL_2PIN]  24.77,78.74 0 top
U1  TI_LP5907MFX-3.3/NOPBDBV0005A_L  [DBV0005A_L]  81.79,60.96 270 top
U2  TI_SW-REG_LM3671  [DBV5_TEX]  72.14,60.96 270 top
U3  TVS, 5.5VWM, 18VC (SOT23-6)  [SOT-23-6_AOS]  84.07,88.27 270 bottom
U4  MAXIM_MAX3311EEUB+T  [21-0061L_MXM]  20.83,83.57 180 top
U5  MAXIM_MAX889RESA  [SOIC127P600X175-8N]  64.39,20.07 270 top
U6  MAX3080EESD+  [21-0041B_14_MXM]  51.56,20.07 270 top
U7  TVS, 5.5VWM, 18VC (SOT23-6)  [SOT-23-6_AOS]  63.75,91.31 270 bottom
U8  TVS, 5.5VWM, 18VC (SOT23-6)  [SOT-23-6_AOS]  43.43,89.03 270 bottom
U9  TVS, 5.5VWM, 18VC (SOT23-6)  [SOT-23-6_AOS]  50.93,91.31 270 bottom
U10  SW_PWR_1CH_DIODES-INC_AP22816BKAWT  [TSOT-25_DIODES-INC]  11.43,42.29 270 top
U11  SW_PWR_1CH_DIODES-INC_AP22816BKAWT  [TSOT-25_DIODES-INC]  58.8,91.06 0 top
U12  SW_PWR_1CH_DIODES-INC_AP22816BKAWT  [TSOT-25_DIODES-INC]  38.48,91.06 0 top
U13  SW_PWR_1CH_DIODES-INC_AP22816BKAWT  [TSOT-25_DIODES-INC]  51.05,88.39 0 top
U14  TI_LP5907MFX-3.3/NOPBDBV0005A_L  [DBV0005A_L]  29.21,34.67 180 top
U15  TI_LP5907MFX-3.3/NOPBDBV0005A_L  [DBV0005A_L]  5.84,37.72 270 top
U16  MODULE_UBLOX_NEO-M8Q-01A  [UBLOX_24LCC]  17.78,28.19 180 top
U17  PIC18F6627T-E/PT  [TQFP64_10X10MC_MCH]  31.24,69.6 0 top
U18  (VTH = 2.93)  [SOT-23_M3_MCH]  45.97,77.47 0 top
U19  MICROCHIP_USB7002-I/KDX  [VQFN100_KDX_MCH]  55.37,69.6 0 top
VBUS1  TST_POINT_PTH_042-OCT  [TST_POINT_PTH_042-OCT]  18.03,42.16 0 top
VBUS2  TST_POINT_PTH_042-OCT  [TST_POINT_PTH_042-OCT]  55.5,92.96 0 top
VBUS3  TST_POINT_PTH_042-OCT  [TST_POINT_PTH_042-OCT]  35.05,93.47 0 top
VBUS4  TST_POINT_PTH_042-OCT  [TST_POINT_PTH_042-OCT]  54.58,88.57 0 top
Y1  F(OSC) = 25MHZ  [OSC_ECS-2033-250-BN]  52.32,78.23 180 top